# Altium project tc264主板.PrjPcb
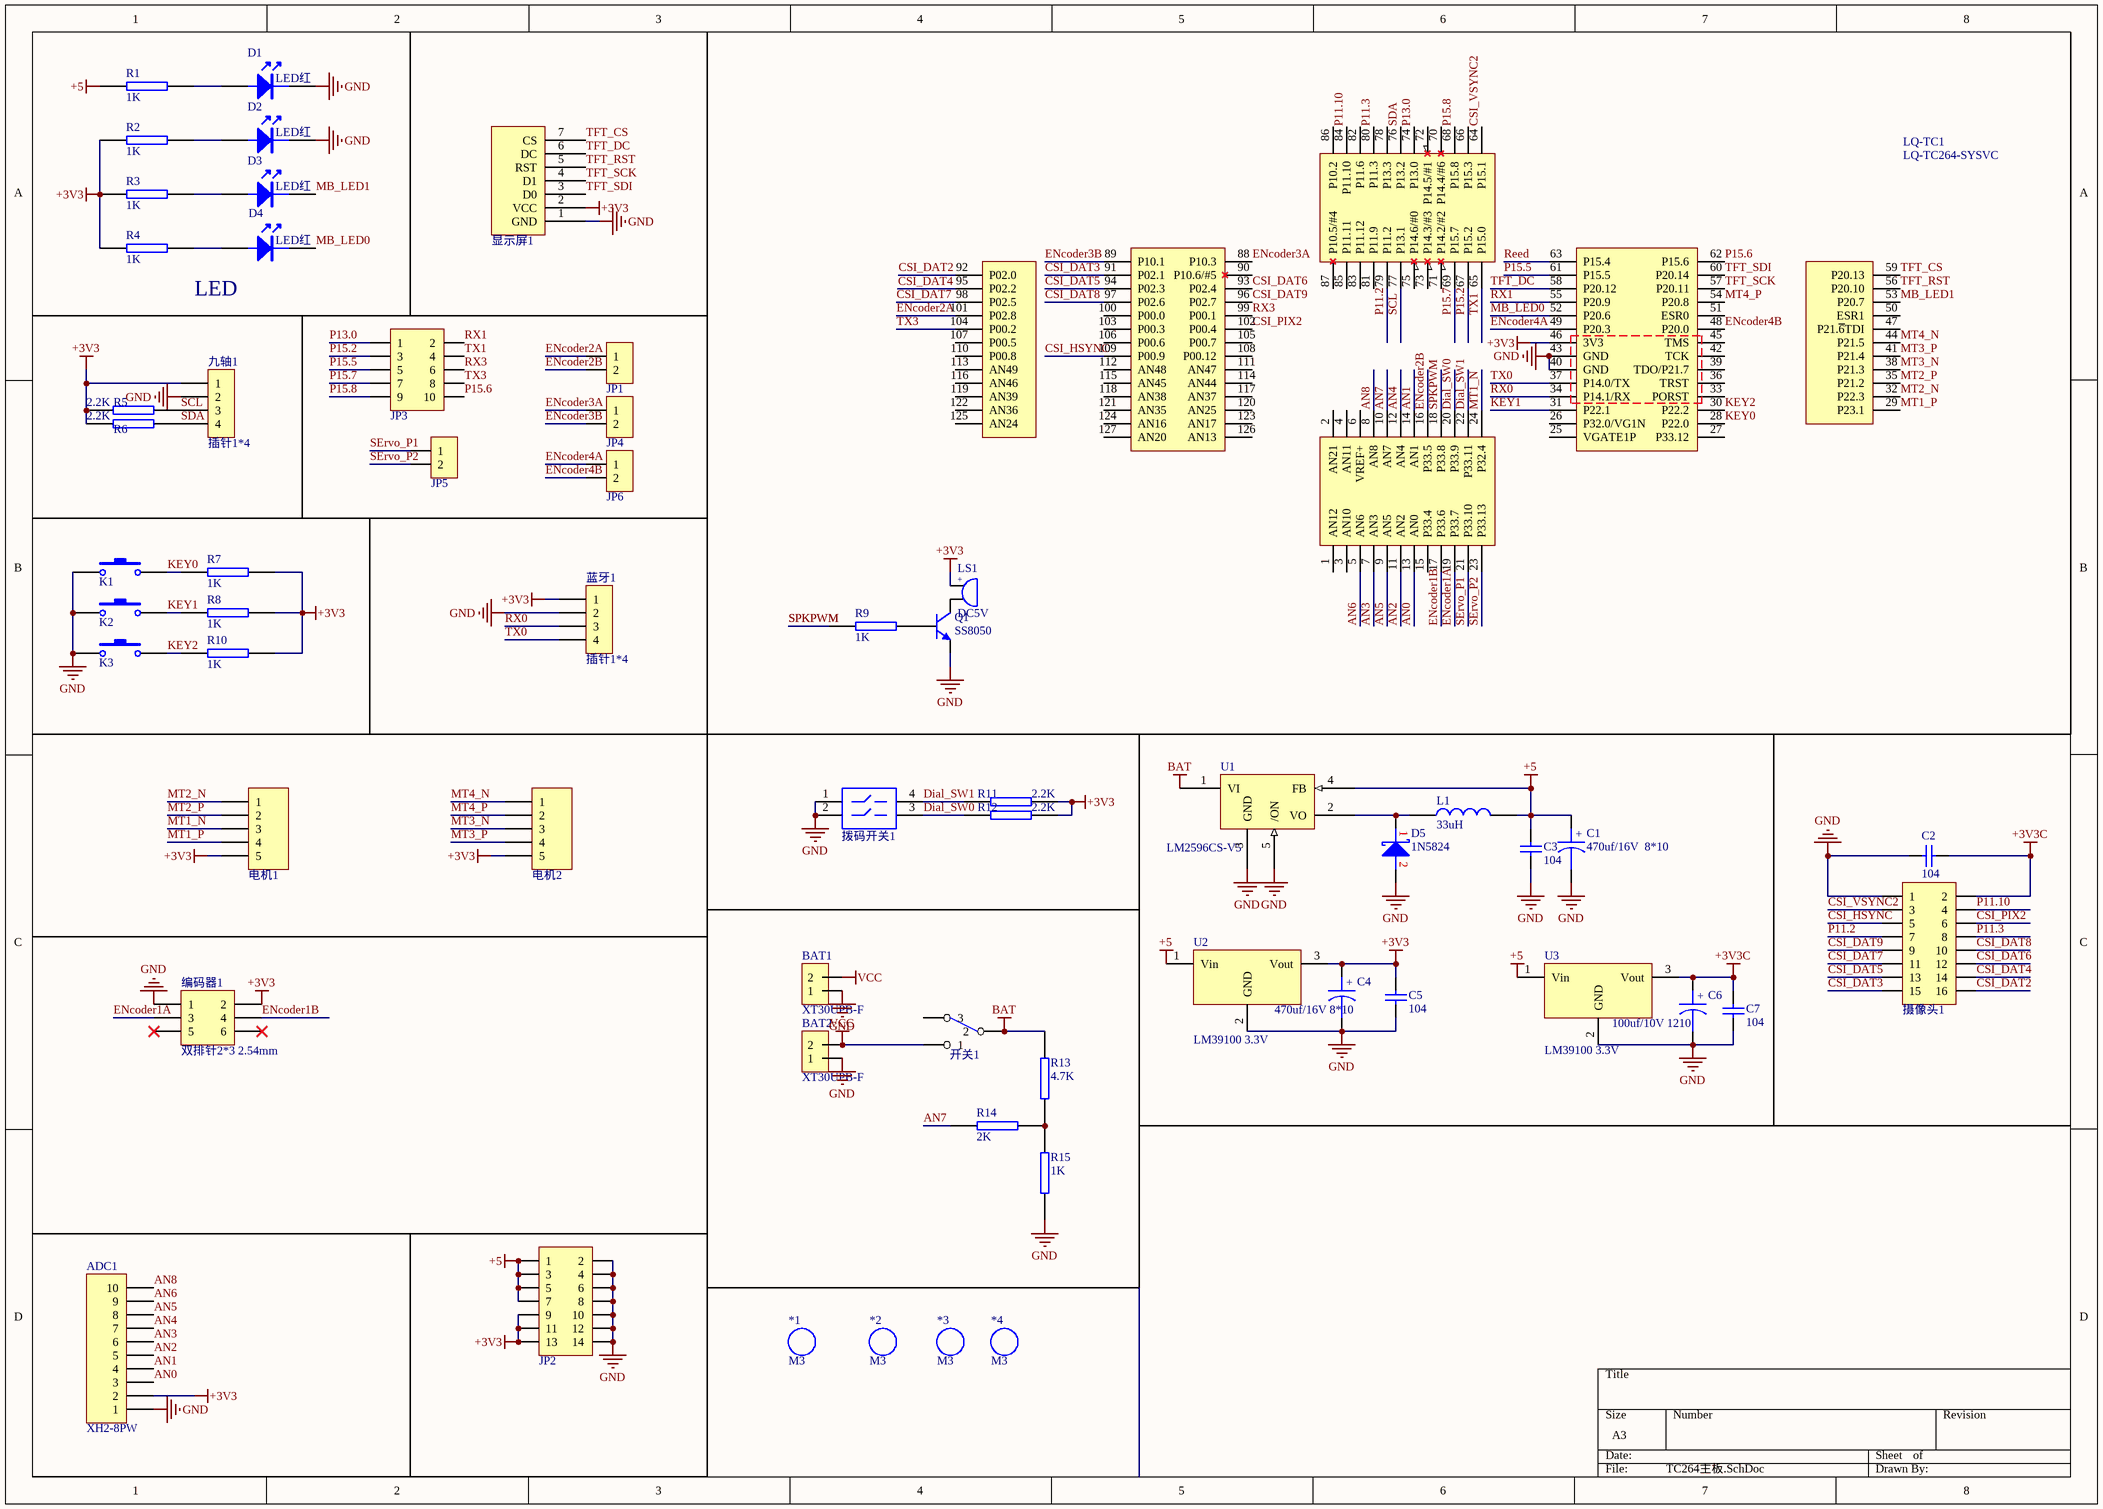
[diagram p0: TC264主板.SchDoc]
1 sheet, 59 parts. Net scope: global (net labels, ports and power ports of the same name join across sheets).
Board file: tc264主板.PcbDoc

## Sheet TC264主板.SchDoc
size A3

### Parts
*1  M3  [M3 125X200]
*2  M3  [M3 125X200]
*3  M3  [M3 125X200]
*4  M3  [M3 125X200]
ADC1  XH2-8PW  [LQ_IDC5X2]
BAT1  XT30UPB-F  [LQ_XT30UPB-F]
BAT2  XT30UPB-F  [LQ_XT30UPB-F]
C1  470uf/16V  8*10  [CE E(8*10.2)]
C2  104  [LQ_C0603]
C3  104  [LQ_C0603]
C4  470uf/16V 8*10  [CE E(8*10.2)]
C5  104  [LQ_C0603]
C6  100uf/10V 1210  [C1210_NS]
C7  104  [LQ_C0603]
D1  LED红  [LQ_LED0603R]
D2  LED红  [LQ_LED0603R]
D3  LED红  [LQ_LED0603R]
D4  LED红  [LQ_LED0603R]
D5  1N5824  [LQ_D1812Z]
JP1  HDR-1X2  [HDR2.54-LI-2P]  (value not drawn)
JP2  Header 2X7  [HDR2.54-LI-2x7P]  (value not drawn)
JP3  Header 5X2  [HDR2.54-LI-2x5P]  (value not drawn)
JP4  HDR-1X2  [HDR2.54-LI-2P]  (value not drawn)
JP5  HDR-1X2  [HDR2.54-LI-2P]  (value not drawn)
JP6  HDR-1X2  [HDR2.54-LI-2P]  (value not drawn)
K1  微动开关6*6*6  [LQ_BT4SMT]  (value not drawn)
K2  微动开关6*6*6  [LQ_BT4SMT]  (value not drawn)
K3  微动开关6*6*6  [LQ_BT4SMT]  (value not drawn)
L1  33uH  [LQ_L7X7]
LQ-TC1  LQ-TC264-SYSVC  [LQ-TC264-SYSVC-S]
LS1  DC5V  [BEEP 5x9x5.5]
Q1  SS8050  [SOT23-3N]
R1  1K  [LQ_R0603]
R2  1K  [LQ_R0603]
R3  1K  [LQ_R0603]
R4  1K  [LQ_R0603]
R5  2.2K  [LQ_R0603]
R6  2.2K  [LQ_R0603]
R7  1K  [LQ_R0603]
R8  1K  [LQ_R0603]
R9  1K  [LQ_R0603]
R10  1K  [LQ_R0603]
R11  2.2K  [LQ_R0603]
R12  2.2K  [LQ_R0603]
R13  4.7K  [LQ_R0603]
R14  2K  [LQ_R0603]
R15  1K  [LQ_R0603]
U1  LM2596CS-V5  [LQ_TO-263-5]
U2  LM39100 3.3V  [SOT223_M]
U3  LM39100 3.3V  [SOT223_M]
九轴1  插针1*4  [HDR2.54-LI-4P]
开关1  KCD1-101 117S  [LQ_KCD1-101 117S]  (value not drawn)
拨码开关1  SW-DIP2  [DIP4]  (value not drawn)
摄像头1  Header 8X2  [HDR2.54-LI-2x8P]  (value not drawn)
显示屏1  单排座1*7-2.54  [LQ-TFT-180V33]  (value not drawn)
电机1  XH254-4P  [HDR2.54-LI-5P]  (value not drawn)
电机2  XH254-4P  [HDR2.54-LI-5P]  (value not drawn)
编码器1  双排针2*3 2.54mm  [LQ_ENCODER]
蓝牙1  插针1*4  [HDR2.54-LI-4P]

### Nets
+3V3: ADC1.2 C4.1 C5.2 JP2.9 JP2.11 JP2.13 LQ-TC1.46(3V3) LS1.1 R2.1 R3.1 R4.1 R5.1 R6.1 R7.2 R8.2 R10.2 R11.2 R12.2 U2.3(Vout) 九轴1.1 显示屏1.2(VCC) 电机1.5 电机2.5 编码器1.2 蓝牙1.1
+3V3C: C2.2 C6.1 C7.2 U3.3(Vout) 摄像头1.2
+5: C1.1 C3.2 JP2.1 JP2.3 JP2.5 JP2.7 L1.2 R1.1 U1.4(FB) U2.1(Vin) U3.1(Vin)
BAT: R13.2 U1.1(VI) 开关1.2
GND: ADC1.1 BAT1.1 BAT2.1 C1.2 C2.1 C3.1 C4.2 C5.1 C6.2 C7.1 D1.2 D2.2 D5.2 JP2.2 JP2.4 JP2.6 JP2.8 JP2.10 JP2.12 JP2.14 K1.1 K2.1 K3.1 LQ-TC1.40(GND) LQ-TC1.43(GND) Q1.2(E) R15.2 U1.3(GND) U1.5(/ON) U2.2(GND) U3.2(GND) 九轴1.2 拨码开关1.1 拨码开关1.2 摄像头1.1 显示屏1.1(GND) 编码器1.1 蓝牙1.2
VCC: BAT1.2 BAT2.2 开关1.1
AN0: ADC1.3 LQ-TC1.13(AN0)
AN1: ADC1.4 LQ-TC1.14(AN1)
AN2: ADC1.5 LQ-TC1.11(AN2)
AN3: ADC1.6 LQ-TC1.7(AN3)
AN4: ADC1.7 LQ-TC1.12(AN4)
AN5: ADC1.8 LQ-TC1.9(AN5)
AN6: ADC1.9 LQ-TC1.5(AN6)
AN7: LQ-TC1.10(AN7) R14.2
AN8: ADC1.10 LQ-TC1.8(AN8)
CSI_DAT2: LQ-TC1.92(P02.0) 摄像头1.16
CSI_DAT3: LQ-TC1.91(P02.1) 摄像头1.15
CSI_DAT4: LQ-TC1.95(P02.2) 摄像头1.14
CSI_DAT5: LQ-TC1.94(P02.3) 摄像头1.13
CSI_DAT6: LQ-TC1.93(P02.4) 摄像头1.12
CSI_DAT7: LQ-TC1.98(P02.5) 摄像头1.11
CSI_DAT8: LQ-TC1.97(P02.6) 摄像头1.10
CSI_DAT9: LQ-TC1.96(P02.7) 摄像头1.9
CSI_HSYNC: LQ-TC1.109(P00.9) 摄像头1.5
CSI_PIX2: LQ-TC1.102(P00.4) 摄像头1.6
CSI_VSYNC2: LQ-TC1.64(P15.1) 摄像头1.3
Dial_SW0: LQ-TC1.20(P33.9) R12.1 拨码开关1.3
Dial_SW1: LQ-TC1.22(P33.11) R11.1 拨码开关1.4
ENcoder1A: LQ-TC1.19(P33.7) 编码器1.3
ENcoder1B: LQ-TC1.17(P33.6) 编码器1.4
ENcoder2A: JP1.1 LQ-TC1.101(P02.8)
ENcoder2B: JP1.2 LQ-TC1.16(P33.5)
ENcoder3A: JP4.1 LQ-TC1.88(P10.3)
ENcoder3B: JP4.2 LQ-TC1.89(P10.1)
ENcoder4A: JP6.1 LQ-TC1.49(P20.3)
ENcoder4B: JP6.2 LQ-TC1.48(P20.0)
KEY0: K1.2 LQ-TC1.28(P22.0) R7.1
KEY1: K2.2 LQ-TC1.31(P22.1) R8.1
KEY2: K3.2 LQ-TC1.30(P22.2) R10.1
MB_LED0: D4.2 LQ-TC1.52(P20.6)
MB_LED1: D3.2 LQ-TC1.53(P20.7)
MT1_N: LQ-TC1.24(P32.4) 电机1.3
MT1_P: LQ-TC1.29(P23.1) 电机1.4
MT2_N: LQ-TC1.32(P22.3) 电机1.1
MT2_P: LQ-TC1.35(P21.2) 电机1.2
MT3_N: LQ-TC1.38(P21.3) 电机2.3
MT3_P: LQ-TC1.41(P21.4) 电机2.4
MT4_N: LQ-TC1.44(P21.5) 电机2.1
MT4_P: LQ-TC1.54(P20.8) 电机2.2
P11.2: LQ-TC1.79(P11.2) 摄像头1.7
P11.3: LQ-TC1.80(P11.3) 摄像头1.8
P11.10: LQ-TC1.84(P11.10) 摄像头1.4
P13.0: JP3.1 LQ-TC1.74(P13.0)
P15.2: JP3.3 LQ-TC1.67(P15.2)
P15.5: JP3.5 LQ-TC1.61(P15.5)
P15.6: JP3.10 LQ-TC1.62(P15.6)
P15.7: JP3.7 LQ-TC1.69(P15.7)
P15.8: JP3.9 LQ-TC1.68(P15.8)
Reed: LQ-TC1.63(P15.4)
RX0: LQ-TC1.34(P14.1/RX) 蓝牙1.3
RX1: JP3.2 LQ-TC1.55(P20.9)
RX3: JP3.6 LQ-TC1.99(P00.1)
SCL: LQ-TC1.77(P13.1) R5.2 九轴1.3
SDA: LQ-TC1.76(P13.2) R6.2 九轴1.4
SErvo_P1: JP5.1 LQ-TC1.21(P33.10)
SErvo_P2: JP5.2 LQ-TC1.23(P33.13)
SPKPWM: LQ-TC1.18(P33.8) R9.1
TFT_CS: LQ-TC1.59(P20.13) 显示屏1.7(CS)
TFT_DC: LQ-TC1.58(P20.12) 显示屏1.6(DC)
TFT_RST: LQ-TC1.56(P20.10) 显示屏1.5(RST)
TFT_SCK: LQ-TC1.57(P20.11) 显示屏1.4(D1)
TFT_SDI: LQ-TC1.60(P20.14) 显示屏1.3(D0)
TX0: LQ-TC1.37(P14.0/TX) 蓝牙1.4
TX1: JP3.4 LQ-TC1.65(P15.0)
TX3: JP3.8 LQ-TC1.104(P00.2)
NetD1_1: D1.1 R1.2
NetD2_1: D2.1 R2.2
NetD3_1: D3.1 R3.2
NetD4_1: D4.1 R4.2
NetD5_1: D5.1 L1.1 U1.2(VO)
NetLS1_2: LS1.2 Q1.3(C)
NetQ1_1: Q1.1(B) R9.2
NetR13_1: R13.1 R14.1 R15.1

Not connected (* = marked no-connect by the designer): LQ-TC1 1(AN12) 2(AN21) 3(AN10) 4(AN11) 6(VREF+) 15(P33.4) 25(VGATE1P) 26(P32.0/VG1N) 27(P33.12) 33(PORST) 36(TRST) 39(TDO/P21.7) 42(TCK) 45(TMS) 47(P21.~{6}TDI) 50(ESR1) 51(ESR0) 66(P15.3) 70(P14.4/#6) 71(P14.2/#2) 72(P14.5/#1) 73(P14.3/#3) 75(P14.6/#0) 78(P13.3) 81(P11.9) 82(P11.6) 83(P11.12) 85(P11.11) 86(P10.2) 87(P10.5/#4) 90(P10.6/#5) 100(P00.0) 103(P00.3) 105(P00.7) 106(P00.6) 107(P00.5) 108(P00.12) 110(P00.8) 111(AN47) 112(AN48) 113(AN49) 114(AN44) 115(AN45) 116(AN46) 117(AN37) 118(AN38) 119(AN39) 120(AN25) 121(AN35) 122(AN36) 123(AN17) 124(AN16) 125(AN24) 126(AN13) 127(AN20); 开关1 3; 编码器1 5* 6*

### Notes on the sheet
- LED
- (in symbol BEEP) +
- (in symbol DIP-SW-4P) NO

### Library data of the parts
*1-*4 = M3: 铜柱孔; 联系卖家，免费查找封装: 唯一出售店铺网址https://shop463601444.taobao.com; 封装库来自淘宝卖家：黄晶宝石: 其他店铺购入均为盗版封装库，请立即申请退款，本店现金奖励200~1000元; BOM名称: 铜柱孔
ADC1 = CON10: Connector
BAT1 BAT2 = LQ_PIN2: Jumper
C1 C4 C6 = CAPACITOR POL: Capacitor
C2 C3 C5 C7 = Cap: Capacitor; Published: 8-Jun-2000; LatestRevisionDate: 17-Jul-2002; LatestRevisionNote: Re-released for DXP Platform.; PackageReference: RAD-0.3; Publisher: Altium Limited; PackageDescription: Radial Cap, Thru-Hole; 2 Leads; 0.3 in Pin Spacing; Value: 104
D1-D4 = LED
D5 = LQ_Z: Schottky Diode
JP1 JP4-JP6 = Header 2: 2P接插件; 联系卖家，免费查找封装: 唯一出售店铺网址https://shop463601444.taobao.com; 封装库来自淘宝卖家ID：黄晶宝石: 其他店铺购入均为盗版封装库，请立即申请退款，本店现金奖励50~200元; BOM名称: 2P接插件
JP2 = Header 7X2: 7*2P接插件; 联系卖家，免费查找封装: 唯一出售店铺网址https://shop463601444.taobao.com; 封装库来自淘宝卖家ID：黄晶宝石: 其他店铺购入均为盗版封装库，请立即申请退款，本店现金奖励50~200元; BOM名称: 7*2P接插件
JP3 = Header 5X2: 5*2P接插件; 联系卖家，免费查找封装: 唯一出售店铺网址https://shop463601444.taobao.com; 封装库来自淘宝卖家ID：黄晶宝石: 其他店铺购入均为盗版封装库，请立即申请退款，本店现金奖励50~200元; BOM名称: 5*2P接插件
K1-K3 = 微动开关
L1 = INDUCTOR
LS1 = BEEP: 蜂鸣器; 联系卖家，免费查找封装: 唯一出售店铺网址https://shop463601444.taobao.com; 封装库来自淘宝卖家：黄晶宝石: 其他店铺购入均为盗版封装库，请立即申请退款，本店现金奖励200~1000元; BOM名称: 蜂鸣器
Q1 = 8050-SMD: 高频放大-NPN型; 参数: 40V 1.5A 1W 100MHZ; 8元以下特价购入的买家: 还可以联系卖家远程指导AD软件使用; BOM名称: 高频放大-NPN型
R1-R15 = RES2
U1 = LM2575T
U2 U3 = VOLTREG
九轴1 蓝牙1 = CON4: Connector
开关1 = LQ_SWMTS102
摄像头1 = Header 8X2: 8*2P接插件; 联系卖家，免费查找封装: 唯一出售店铺网址https://shop463601444.taobao.com; 封装库来自淘宝卖家ID：黄晶宝石: 其他店铺购入均为盗版封装库，请立即申请退款，本店现金奖励50~200元; BOM名称: 8*2P接插件
显示屏1 = LQ_OLED128X64
电机1 电机2 = Header 5: Header, 5-Pin; LatestRevisionDate: 17-Jul-2002; LatestRevisionNote: Re-released for DXP Platform.; Publisher: Altium Limited
编码器1 = Header 3X2: Header, 3-Pin, Dual row; LatestRevisionDate: 17-Jul-2002; LatestRevisionNote: Re-released for DXP Platform.; Publisher: Altium Limited